# EAGLE design mbc_80_26_08_05_ESP32 (EAGLE 7.6.0)
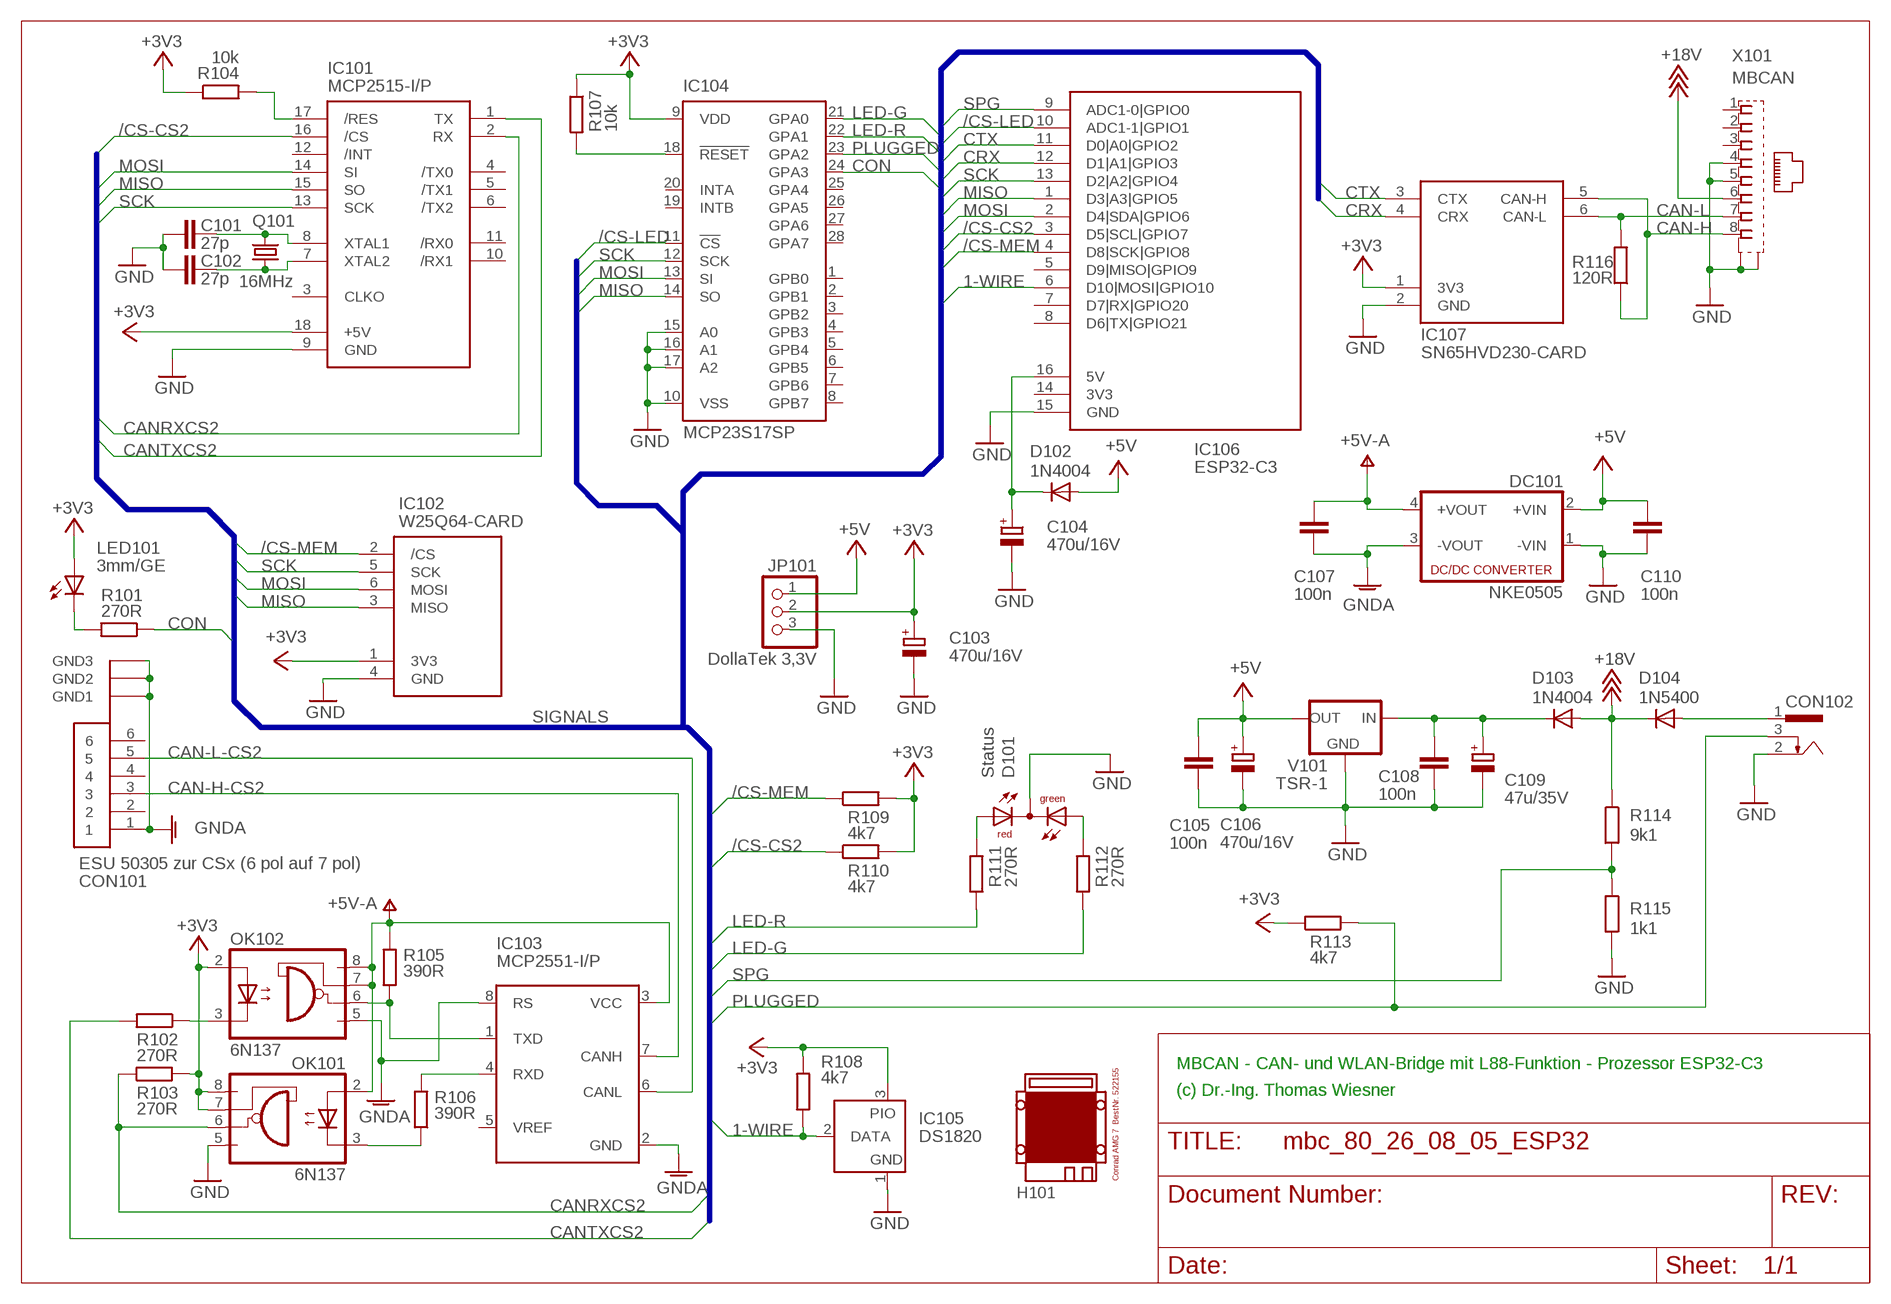
[diagram p0: schematic, sheet 1]

## Parts
C101  27p  C-EU025-025X050  [C025-025X050]
C102  27p  C-EU025-025X050  [C025-025X050]
C103  470u/16V  CPOL-EUE3.5-8  [E3,5-8]
C104  470u/16V  CPOL-EUE3.5-8  [E3,5-8]
C105  100n  C-EU025-025X050  [C025-025X050]
C106  470u/16V  CPOL-EUE3.5-8  [E3,5-8]
C107  100n  C-EU025-025X050  [C025-025X050]
C108  100n  C-EU025-025X050  [C025-025X050]
C109  47u/35V  CPOL-EUE2.5-7  [E2,5-7]
C110  100n  C-EU025-025X050  [C025-025X050]
CON101  ESU 50305 zur CSx (6 pol auf 7 pol)  TM-0508-A6  [MINI-DIN-6-POL]
CON102  POWER-JACK  [POWER-JACK]
D101  Status  DUOLED5MM  [DUOLED5MM]
D102  1N4004  [DO41-10]
D103  1N4004  [DO41-10]
D104  1N5400  [DO201-15]
DC101  NKE0505  NME  [NME]
H101  MODULGEHÄUSE-AMG-7  [MODULGEHÄUSE-AMG-7]
IC101  MCP2515-I/P  MCP2510-I/P  [DIL18]
IC102  W25Q64-CARD  [W25Q64CARD]
IC103  MCP2551-I/P  PCA82C250  [DIL08]
IC104  MCP23S17SP  [DIL28-3]
IC105  DS1820  DS2405  [TO92-]
IC106  ESP32-C3  [ESP32-C3]
IC107  SN65HVD230-CARD  [SN65HVD230-CARD]
JP101  DollaTek 3,3V  PINHD-1X3  [1X03]
LED101  3mm/GE  LED3MM  [LED3MM]
OK101  6N137  [DIL08]
OK102  6N137  [DIL08]
Q101  16MHz  CRYSTALHC49U-V  [HC49U-V]
R101  270R  R-EU_0207/10  [0207/10]
R102  270R  R-EU_0207/10  [0207/10]
R103  270R  R-EU_0207/10  [0207/10]
R104  10k  R-EU_0207/10  [0207/10]
R105  390R  R-EU_0207/10  [0207/10]
R106  390R  R-EU_0207/10  [0207/10]
R107  10k  R-EU_0207/10  [0207/10]
R108  4k7  R-EU_0207/10  [0207/10]
R109  4k7  R-EU_0207/10  [0207/10]
R110  4k7  R-EU_0207/10  [0207/10]
R111  270R  R-EU_0207/10  [0207/10]
R112  270R  R-EU_0207/10  [0207/10]
R113  4k7  R-EU_0207/10  [0207/10]
R114  9k1  R-EU_0207/10  [0207/10]
R115  1k1  R-EU_0207/10  [0207/10]
R116  120R  R-EU_0207/10  [0207/10]
V101  TSR-1  [TRACO-TSR-1]
X101  MBCAN  0446200002  [0446200002]

## Nets
1-WIRE: IC105.2(DATA) IC106.6(D10|MOSI|GPIO10) R108.1
+3V3: C103.+ IC101.18(+5V) IC102.1(3V3) IC104.9(VDD) IC105.3(PIO) IC107.1(3V3) JP101.2 LED101.A OK101.7(VE) OK101.8(VCC) OK102.2(A) R103.2 R104.1 R107.1 R108.2 R109.2 R110.2 R113.1
+5V: C105.1 C106.+ C110.1 D102.A DC101.2(+VIN) JP101.1 V101.OUT
+5V-A: C107.1 DC101.4(+VOUT) IC103.3(VCC) OK101.2(A) OK102.7(VE) OK102.8(VCC) R105.2
+18V: D103.A D104.C R114.1 X101.6
/CS-CS2: IC101.16(/CS) IC106.3(D5|SCL|GPIO7) R110.1
/CS-LED: IC104.11(!CS) IC106.10(ADC1-1|GPIO1)
/CS-MEM: IC102.2(/CS) IC106.4(D8|SCK|GPIO8) R109.1
CAN-H: IC107.5(CAN-H) R116.1 X101.8
CAN-H-CS2: CON101.3 IC103.7(CANH)
CAN-L: IC107.6(CAN-L) R116.2 X101.7
CAN-L-CS2: CON101.5 IC103.6(CANL)
CANRXCS2: IC101.2(RX) OK101.6(VO) R103.1
CANTXCS2: IC101.1(TX) R102.2
CON: IC104.24(GPA3) R101.1
CRX: IC106.12(D1|A1|GPIO3) IC107.4(CRX)
CTX: IC106.11(D0|A0|GPIO2) IC107.3(CTX)
GND: C101.2 C102.2 C103.- C104.- C105.2 C106.- C108.2 C109.- C110.2 CON102.2 D101.K(C) DC101.1(-VIN) IC101.9(GND) IC102.4(GND) IC104.10(VSS) IC104.15(A0) IC104.16(A1) IC104.17(A2) IC105.1(GND) IC106.15(GND) IC107.2(GND) JP101.3 OK101.5(GND) R115.2 V101.GND X101.4 X101.5 X101.S@1(S1) X101.S@2(S2)
GNDA: C107.2 CON101.1 CON101.A1(GND1) CON101.A2(GND2) CON101.A3(GND3) DC101.3(-VOUT) IC103.2(GND) IC103.8(RS) OK102.5(GND)
LED-G: IC104.21(GPA0) R112.1
LED-R: IC104.22(GPA1) R111.1
MISO: IC101.15(SO) IC102.3(MISO) IC104.14(SO) IC106.1(D3|A3|GPIO5)
MOSI: IC101.14(SI) IC102.6(MOSI) IC104.13(SI) IC106.2(D4|SDA|GPIO6)
N$1: IC104.18(!RESET) R107.2
N$2: IC101.17(/RES) R104.2
N$3: LED101.K(C) R101.2
N$6: C108.1 C109.+ D103.C V101.IN
N$7: C101.1 IC101.8(XTAL1) Q101.2
N$8: C102.1 IC101.7(XTAL2) Q101.1
N$9: D101.AR R111.2
N$13: D101.AG R112.2
N$22: C104.+ D102.C IC106.16(5V)
N$40: IC103.1(TXD) OK102.6(VO) R105.1
N$43: OK101.3(C) R106.1
N$44: IC103.4(RXD) R106.2
N$46: OK102.3(C) R102.1
PLUGGED: CON102.3 IC104.23(GPA2) R113.2
SCK: IC101.13(SCK) IC102.5(SCK) IC104.12(SCK) IC106.13(D2|A2|GPIO4)
SPG: IC106.9(ADC1-0|GPIO0) R114.2 R115.1
V-NETZTEIL: CON102.1 D104.A
Unconnected: CON101.2 CON101.4 CON101.6 IC101.3(CLKO) IC101.4(/TX0) IC101.5(/TX1) IC101.6(/TX2) IC101.10(/RX1) IC101.11(/RX0) IC101.12(/INT) IC103.5(VREF) IC104.1(GPB0) IC104.2(GPB1) IC104.3(GPB2) IC104.4(GPB3) IC104.5(GPB4) IC104.6(GPB5) IC104.7(GPB6) IC104.8(GPB7) IC104.19(INTB) IC104.20(INTA) IC104.25(GPA4) IC104.26(GPA5) IC104.27(GPA6) IC104.28(GPA7) IC106.5(D9|MISO|GPIO9) IC106.7(D7|RX|GPIO20) IC106.8(D6|TX|GPIO21) IC106.14(3V3) X101.1 X101.2 X101.3

## Buses
SIGNALS

## Notes on the sheet
- MBCAN - CAN- und WLAN-Bridge mit L88-Funktion - Prozessor ESP32-C3
- (c) Dr.-Ing. Thomas Wiesner

## Library data of the parts
C101 C102 C105 C107 C108 C110 = rcl:C-EU: CAPACITOR, European symbol
C103 C104 C106 C109 = rcl:CPOL-EU: POLARIZED CAPACITOR, European symbol
CON101 = mbc:TM-0508-A6: MINI-DIN 6-pol Printbuchse Reichelt Bestellnummer EB-DIO M06
CON102 = mbc:POWER-JACK: Power-Stecker für 2,5 mm Hohlbuchse
D101 = led:DUOLED5MM: DUO LED 2 colors, 5 mm, round
D102 D103 = diode:1N4004: DIODE general purpose rectifier, 1 A
D104 = diode:1N5400: DIODE standard rectifier, 3 A, 50 V (Motorola)
DC101 = dc-dc-converter:NME: DC-DC CONVERTER; MF: C & D TECHNOLOGIES, INC; MPN: NME1205D; OC_FARNELL: 1021466; OC_NEWARK: 98B8198
H101 = mbc:MODULGEHÄUSE-AMG-7: Gehäuse Conrad AMG 7 BestNr. 522155
IC101 = mbc:MCP2510: BASIC-CAN 2.0a Controller Stand-alone CAN controller von Microchip
IC102 = mbc:W25Q64-CARD: NOR-FLASH 8 MByte mit SPI
IC103 = micro-philips:PCA82C250: CAN CONTROLLER INTERFACE; OC_FARNELL: 3692358; OC_NEWARK: unknown
IC104 = microchip:MCP23S17: http://ww1.microchip.com/downloads/en/DeviceDoc/21952a.pdf Source: http://ww1.microchip.com/downloads/en/DeviceDoc/21952a.pdf; MF: MICROCHIP; MPN: MCP23S17-E/SP; OC_FARNELL: 1292238; OC_NEWARK: 31K2951
IC105 = maxim:DS2405: Addressable Switch DALLAS Semiconductor; MF: DALLAS SEMICONDUCTOR; MPN: DS2405; OC_FARNELL: 1188025; OC_NEWARK: 06F4645
IC106 = mbc:ESP32-C3
IC107 = mbc:SN65HVD230-CARD: CAN-Transceiver für 3V3-Anwendungen. Entferne R2 auf dem Board um fixen Terminator zu vermeiden.
JP101 = pinhead:PINHD-1X3: PIN HEADER
LED101 = led:LED: LED OSRAM: - CHIPLED LG R971, LG N971, LY N971, LG Q971, LY Q971, LO R971, LY R971 LH N974, LH R974 LS Q976, LO Q976, LY Q976 LO Q996 - Hyper CHIPLED LW Q18S LB Q993, LB Q99A, LB R99A - SideLED LS A670, LO A670, LY A670, LG A670, LP A670 LB A673, LV A673, LT A673, LW A673 LH A674 LY A675 LS A676, LA A676, LO A676, LY A676, LW A676 LS A679, LY A679, LG A679 - Hyper Micro SIDELED® LS Y876, LA Y876, LO Y876, LY Y876 LT Y87S - SmartLED LW L88C, LW L88S LB L89C, LB L89S, LG L890 LS L89K, LO L89K, LY L89K LS L896, LA L896, LO L896, LY L896 - TOPLED LS T670, LO T670, LY T670, LG T670, LP T670 LSG T670, LSP T670, LSY T670, LOP T670, LYG T670 LG T671, LOG T671, LSG T671 LB T673, LV T673, LT T673, LW T673 LH T674 LS T676, LA T676, LO T676, LY T676, LB T676, LH T676, LSB T676, LW T676 LB T67C, LV T67C, LT T67C, LS T67K, LO T67K, LY T67K, LW E67C LS E67B, LA E67B, LO E67B, LY E67B, LB E67C, LV E67C, LT E67C LW T67C LS T679, LY T679, LG T679 LS T770, LO T770, LY T770, LG T770, LP T770 LB T773, LV T773, LT T773, LW T773 LH T774 LS E675, LA E675, LY E675, LS T675 LS T776, LA T776, LO T776, LY T776, LB T776 LHGB T686 LT T68C, LB T68C - Hyper Mini TOPLED® LB M676 - Mini TOPLED Santana® LG M470 LS M47K, LO M47K, LY M47K Source: http://www.osram.convergy.de LUXEON: - LUMILED® LXK2-PW12-R00, LXK2-PW12-S00, LXK2-PW14-U00, LXK2-PW14-V00 LXK2-PM12-R00, LXK2-PM12-S00, LXK2-PM14-U00 LXK2-PE12-Q00, LXK2-PE12-R00, LXK2-PE12-S00, LXK2-PE14-T00, LXK2-PE14-U00 LXK2-PB12-K00, LXK2-PB12-L00, LXK2-PB12-M00, LXK2-PB14-N00, LXK2-PB14-P00, LXK2-PB14-Q00 LXK2-PR12-L00, LXK2-PR12-M00, LXK2-PR14-Q00, LXK2-PR14-R00 LXK2-PD12-Q00, LXK2-PD12-R00, LXK2-PD12-S00 LXK2-PH12-R00, LXK2-PH12-S00 LXK2-PL12-P00, LXK2-PL12-Q00, LXK2-PL12-R00 Source: www.luxeon.com KINGBRIGHT: KA-3528ASYC Source: www.kingbright.com
OK101 OK102 = optocoupler:6N137: MOTOROLA OPTO COUPLER; MPN: 6N137; OC_FARNELL: 1328376; OC_NEWARK: 52M1895
Q101 = crystal:CRYSTAL: CRYSTAL; OC_FARNELL: 1666969; OC_NEWARK: unknown
R101-R116 = resistor:R-EU_: RESISTOR, European symbol
V101 = mbc:TSR-1: Spannungsregler Hersteller: TRACO Typ: TSR-1 5V: TSR 1-2450 Spg: 5V Strom: 1A Reichelt TSR 1-2450
X101 = mbc:0446200002: RJ-45 INVERTED MODULAR JACK ASSEMBLY WITH RJ-11 KEEPOUT FEATURE Source: Data sheet <http://www.farnell.com/datasheets/73207.pdf> MOLEX 0446200002 BUCHSE, RJ45, GESCHIRMT Source: Farnell <http://de.farnell.com/molex/0446200002/buchse-rj45-geschirmt/dp/9251910?ost=9251910>; MF: MOLEX; MPN: 0446200002; OC_FARNELL: 9251910

## Board
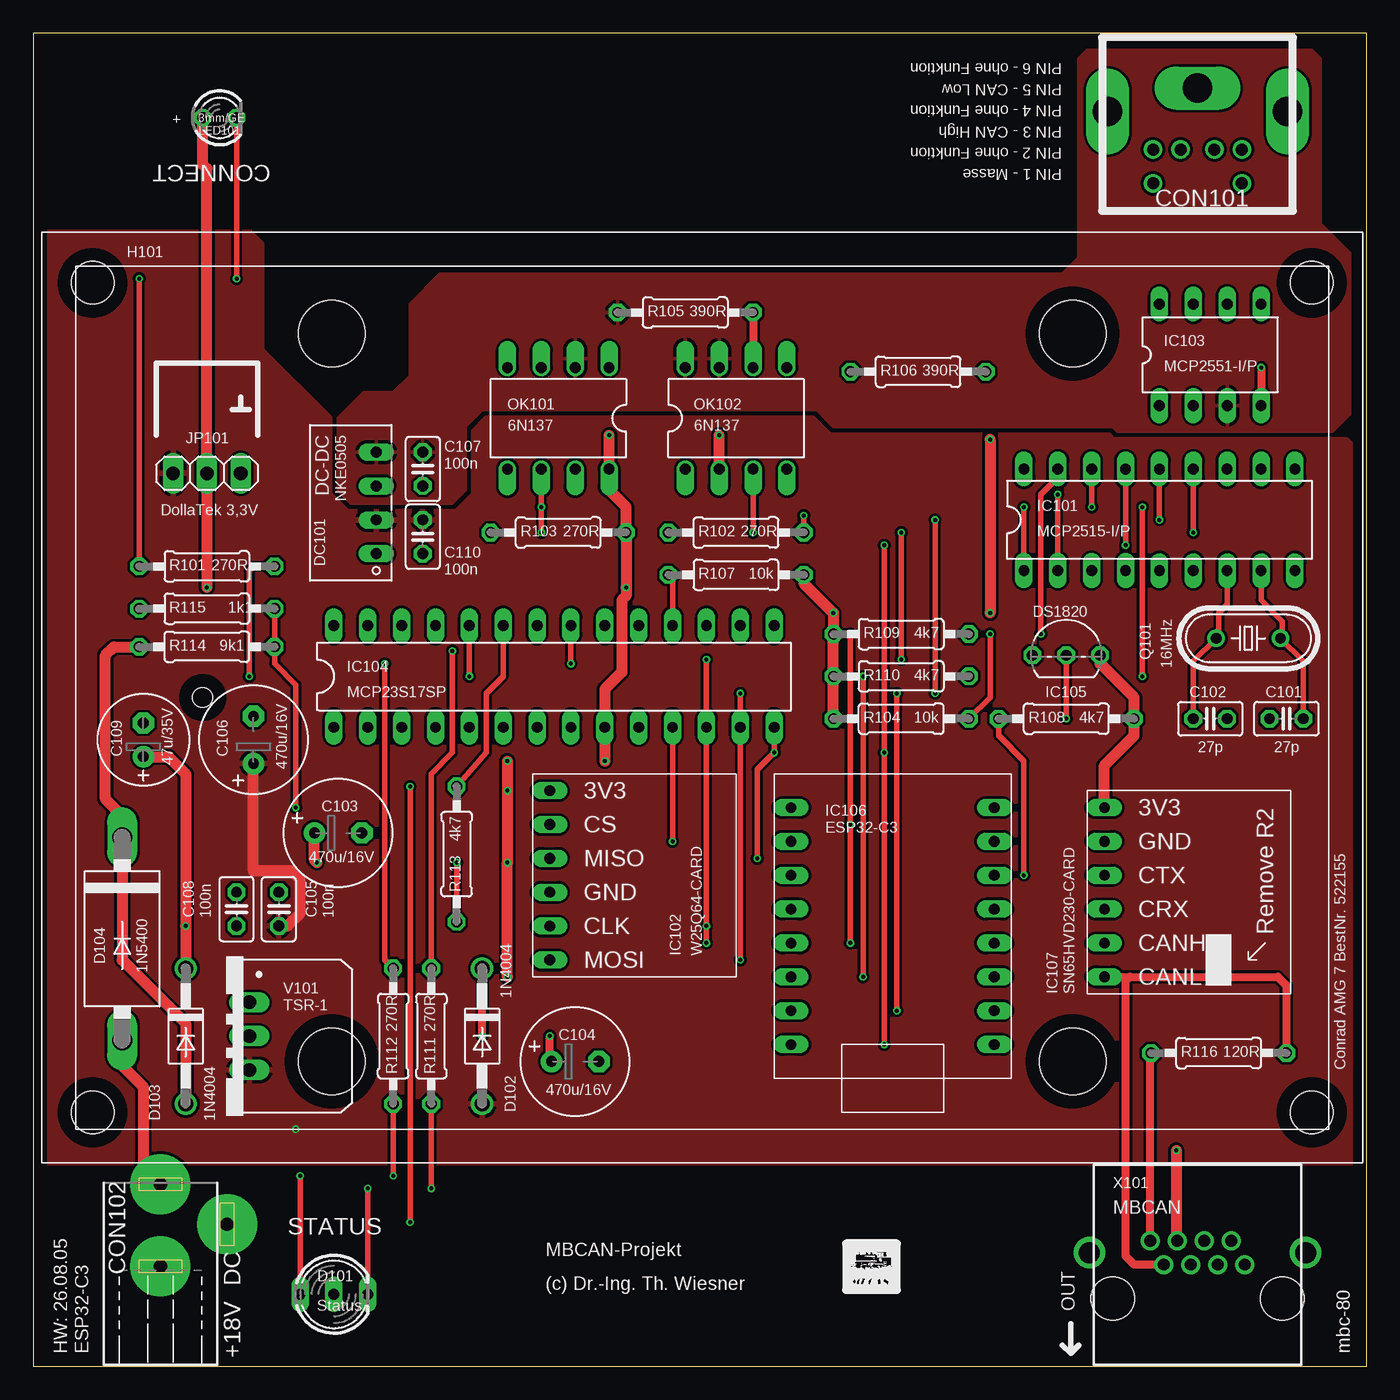
[diagram p1: board, top side]
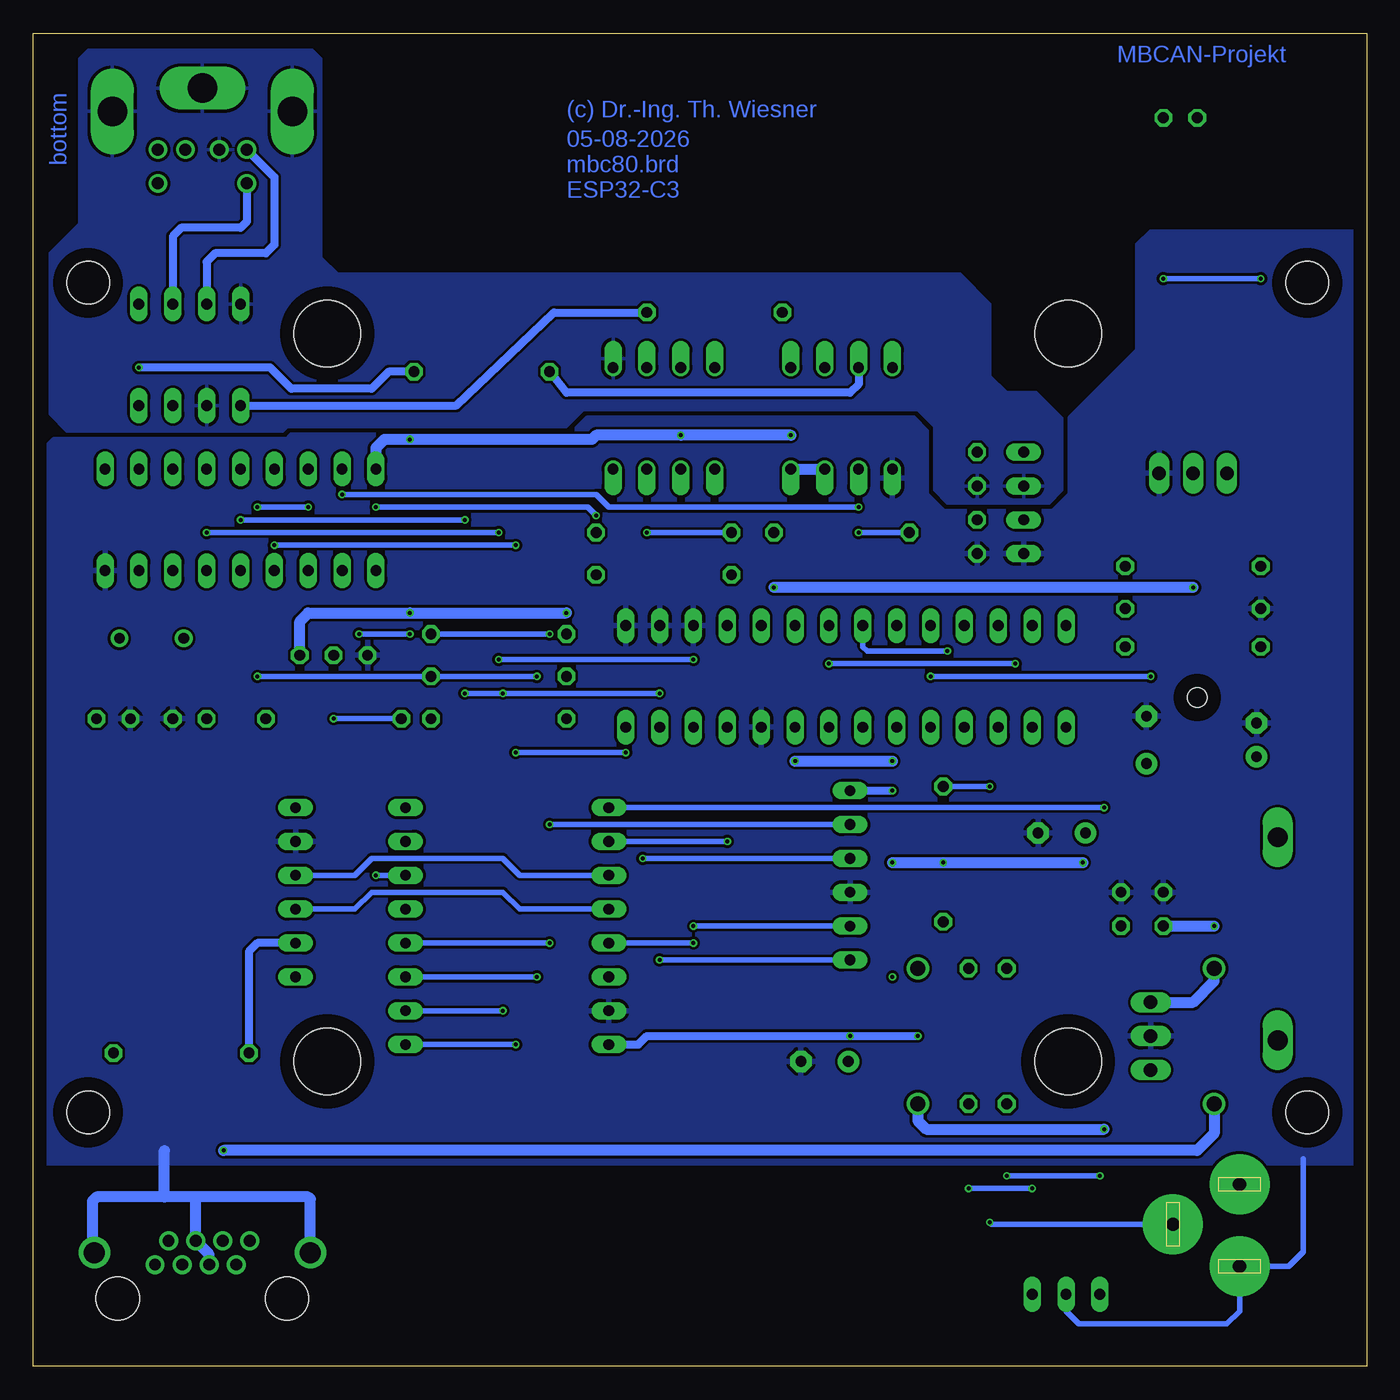
[diagram p2: board, bottom side, seen from below]

Size 99.99 x 100 mm. Coordinates in mm from the lower left corner, seen from the top.
Outline: 0,0 99.99,0 99.99,100 0,100 0,0
Copper layers (1*16): Top 0.035mm / dielectric 1.5mm / Bottom 0.035mm
Design rules "default *": minimum track width 10mil, minimum drill 0.3mm, track to track 8mil, track to pad 8mil, pad to pad 8mil, via to via 8mil, smd to smd 8mil, copper to edge 40mil, drill to drill 8mil, minimum pad ring 10mil, minimum via ring 0.125mm, stop-mask expansion 4mil, vias tented up to drill 0mil, thermal gap 10mil

### Footprints (pad centres in the part's own frame; a part is rotated, then mirrored left to right if it is on the bottom)
C025-025X050 = drill 0.813 octagon: 1 -1.27,0; 2 1.27,0
E3,5-8 = drill 0.813 pad 1.6: + -1.778,0 | drill 0.813 pad 1.6 octagon: - 1.778,0
E2,5-7 = drill 0.813 pad 1.6: + -1.27,0 | drill 0.813 pad 1.6 octagon: - 1.27,0
MINI-DIN-6-POL = drill 0.9: 1 -1.27,-4.604; 2 1.27,-4.604; 3 -3.334,-4.604; 4 3.334,-4.604; 5 -3.334,-7.144; 6 3.334,-7.144 | drill 2.2 pad 2.54 long: A1 0,0.01; A2 -6.75,-1.746; A3 6.75,-1.746
POWER-JACK = drill 1 pad 4.5: 1 0,6.03; 2 0,-0.12; 3 5,3.03
DUOLED5MM = drill 0.813 long: AG -2.54,0; AR 2.54,0; K 0,0
DO41-10 = drill 1.118: A 5.08,0; C -5.08,0
DO201-15 = drill 1.499 long: A 7.62,0; C -7.62,0
NME = drill 0.813 long: 1 0,3.81; 2 0,1.27; 3 0,-1.27; 4 0,-3.81
MODULGEHÄUSE-AMG-7 = hole 3.2: -45.72,-31.115; -45.72,31.115; 45.72,31.115; 45.72,-31.115 | hole 5: -27.781,-27.305; 27.781,-27.305; -27.781,27.305; 27.781,27.305 | hole 1.5: -37.465,0
DIL18 = drill 0.813 long: 1 -10.16,-3.81; 2 -7.62,-3.81; 3 -5.08,-3.81; 4 -2.54,-3.81 | drill 0.8 long: 5 0,-3.81; 6 2.54,-3.81; 7 5.08,-3.81; 8 7.62,-3.81; 9 10.16,-3.81; 10 10.16,3.81; 11 7.62,3.81; 12 5.08,3.81; 13 2.54,3.81; 14 0,3.81; 15 -2.54,3.81; 16 -5.08,3.81; 17 -7.62,3.81; 18 -10.16,3.81
W25Q64CARD = drill 0.8 long: 1 -6.35,6.35; 2 -6.35,3.81; 3 -6.35,1.27; 4 -6.35,-1.27; 5 -6.35,-3.81; 6 -6.35,-6.35
DIL08 = drill 0.813 long: 1 -3.81,-3.81; 2 -1.27,-3.81; 3 1.27,-3.81; 4 3.81,-3.81; 5 3.81,3.81; 6 1.27,3.81; 7 -1.27,3.81; 8 -3.81,3.81
DIL28-3 = drill 0.813 long: 1 -16.51,-3.81; 2 -13.97,-3.81; 3 -11.43,-3.81; 4 -8.89,-3.81; 5 -6.35,-3.81; 6 -3.81,-3.81; 7 -1.27,-3.81; 8 1.27,-3.81; 9 3.81,-3.81; 10 6.35,-3.81; 11 8.89,-3.81; 12 11.43,-3.81; 13 13.97,-3.81; 14 16.51,-3.81; 15 16.51,3.81; 16 13.97,3.81; 17 11.43,3.81; 18 8.89,3.81; 19 6.35,3.81; 20 3.81,3.81; 21 1.27,3.81; 22 -1.27,3.81; 23 -3.81,3.81; 24 -6.35,3.81; 25 -8.89,3.81; 26 -11.43,3.81; 27 -13.97,3.81; 28 -16.51,3.81
TO92- = drill 0.813 octagon: 1 -2.54,0; 2 0,0; 3 2.54,0
ESP32-C3 = drill 0.8 long: 1 -7.62,8.89; 2 -7.62,6.35; 3 -7.62,3.81; 4 -7.62,1.27; 5 -7.62,-1.27; 6 -7.62,-3.81; 7 -7.62,-6.35; 8 -7.62,-8.89; 9 7.62,-8.89; 10 7.62,-6.35; 11 7.62,-3.81; 12 7.62,-1.27; 13 7.62,1.27; 14 7.62,3.81; 15 7.62,6.35; 16 7.62,8.89
SN65HVD230-CARD = drill 0.8 long: 1 -6.35,6.35; 2 -6.35,3.81; 3 -6.35,1.27; 4 -6.35,-1.27; 5 -6.35,-3.81; 6 -6.35,-6.35
1X03 = drill 1.016 long: 1 -2.54,0; 2 0,0; 3 2.54,0
LED3MM = drill 0.813 octagon: A -1.27,0; K 1.27,0
DIL08' = drill 0.813 offset: 1 -3.81,-3.81; 2 -1.27,-3.81; 3 1.27,-3.81; 4 3.81,-3.81; 5 3.81,3.81; 6 1.27,3.81; 7 -1.27,3.81; 8 -3.81,3.81
HC49U-V = drill 0.813: 1 -2.413,0; 2 2.413,0
0207/10 = drill 0.813 octagon: 1 -5.08,0; 2 5.08,0
TRACO-TSR-1 = drill 1.016 long: GND 0,2.54; IN -2.54,2.54; OUT 2.54,2.54
0446200002 = drill 0.889 pad 1.422: 1 3.556,2.54; 2 2.54,4.318; 3 1.524,2.54; 4 0.508,4.318; 5 -0.508,2.54; 6 -1.524,4.318; 7 -2.54,2.54; 8 -3.556,4.318 | drill 1.575 pad 2.286: S@1 -8.103,3.429; S@2 8.103,3.429 | hole 3.251: 6.35,0; -6.35,0

### Placement (x,y rotation side)
C101  93.98,48.58 180 top
C102  88.27,48.58 0 top
C103  22.86,40.01 0 top
C104  40.64,22.86 0 top
C105  18.41,34.29 90 top
C106  16.51,46.99 90 top
C107  29.21,67.31 270 top
C108  15.24,34.29 90 top
C109  8.26,46.99 90 top
C110  29.21,62.23 270 top
CON101  87.31,95.89 0 top
CON102  9.53,7.62 0 top
D101  22.54,5.4 0 top
D102  33.66,24.77 270 top
D103  11.43,24.77 270 top
D104  6.67,32.07 270 top
DC101  25.72,64.77 180 top
H101  50.16,50.16 0 top
IC101  84.45,63.5 0 top
IC102  45.09,36.83 0 top
IC103  88.27,75.88 0 top
IC104  39.05,51.75 0 top
IC105  77.47,53.34 0 top
IC106  64.45,33.02 180 top
IC107  86.68,35.56 0 top
JP101  13.02,66.99 0 top
LED101  13.97,93.66 0 top
OK101  6N137  [DIL08']  39.37,71.12 180 top
OK102  6N137  [DIL08']  52.7,71.12 0 top
Q101  91.12,54.61 0 top
R101  13.02,60.01 180 top
R102  52.7,62.55 0 top
R103  39.37,62.55 0 top
R104  65.09,48.58 0 top
R105  48.9,79.06 180 top
R106  66.36,74.61 0 top
R107  52.7,59.37 180 top
R108  77.47,48.58 0 top
R109  65.09,54.93 180 top
R110  65.09,51.75 180 top
R111  29.84,24.77 270 top
R112  26.99,24.77 270 top
R113  31.75,38.42 90 top
R114  13.02,53.98 0 top
R115  13.02,56.83 180 top
R116  88.9,23.5 0 top
V101  13.65,24.77 270 top
X101  87.31,5.08 0 top

### Tracks (layer width: path | path; a pad name or v marks a point on that pad's centre or on a via)
1-WIRE  (via drill 0.3)
  Top 0.406: v74.3,36.83 74.3,45.4 72.39,47.31 R108.1 | IC105.2 v77.47,48.58
  Bottom 0.406: IC106.6 v74.3,36.83 | v77.47,48.58 R108.1
+3V3  (via drill 0.3)
  Top 0.406: R113.1 v31.75,37.78
  Top 0.813: v35.56,29.21 v35.56,37.78 v35.56,43.18 v35.56,45.4 | v21.27,37.78 21.08,37.97 C103.+ | v42.86,45.4 IC104.9 42.86,50.8 44.13,52.07 44.13,57.47 44.45,57.78 v44.45,58.42 R103.2 44.45,64.45 43.18,65.72 OK101.8 v43.18,69.85 | OK102.2 v51.44,69.85 | v13.02,58.42 JP101.2 13.02,89.85 12.7,90.17 LED101.A | R104.1 R110.2 R109.2 v60.01,56.52 57.78,58.74 R107.1 | IC107.1 80.33,45.09 82.55,47.31 R108.2 82.55,50.16 80.01,52.7 IC105.3 | v71.75,69.53 v71.75,56.52
  Bottom 0.61: IC102.1 v35.56,43.18
  Bottom 0.813: v35.56,37.78 v31.75,37.78 v21.27,37.78 | v42.86,45.4 v35.56,45.4 | OK101.8 OK101.7 | v43.18,69.85 v51.44,69.85 57.78,69.85 58.1,69.53 v71.75,69.53 73.66,69.53 74.3,68.9 IC101.18 | v13.02,58.42 v44.45,58.42 | IC105.3 80.01,55.88 79.38,56.52 v71.75,56.52 v60.01,56.52
+5V  (via drill 0.3)
  Top 0.813: C105.1 19.05,33.02 20,33.97 20,36.51 19.37,37.15 16.51,37.15 C106.+
  Bottom 0.813: D102.A 33.66,18.41 33.02,17.78 v19.68,17.78
  pour Top: 0.64,15.24 99.69,15.24 99.69,68.26 98.42,69.53 80.96,69.53 80.64,69.85 59.69,69.85 58.42,71.12 33.97,71.12 33.02,70.17 33.02,65.41 31.75,64.14 23.5,64.14 22.23,65.41 22.23,71.12 17.14,76.2 17.14,84.14 16.19,85.09 0.64,85.09
+5V-A
  pour Top: 23.81,64.77 31.43,64.77 32.38,65.72 32.38,70.48 33.66,71.75 58.74,71.75 60.01,70.48 80.96,70.48 81.28,70.17 97.47,70.17 98.74,71.44 98.74,83.5 96.52,85.72 96.52,98.11 95.89,98.74 79.06,98.74 78.42,98.11 78.42,83.19 77.15,81.92 30.48,81.92 28.26,79.69 28.26,74.3 26.99,73.03 24.77,73.03 22.86,71.12 22.86,65.72
+18V  (via drill 0.3)
  Top 0.813: v85.72,16.19 85.72,9.46 X101.6 | D103.A 11.43,25.72 6.67,30.48 D104.C 6.67,41.27 5.4,42.55 5.4,53.34 6.03,53.98 R114.1
  Bottom 0.813: D103.A 11.43,17.46 12.7,16.19 v85.72,16.19
/CS-CS2  (via drill 0.3)
  Top 0.406: v62.23,29.21 v62.23,51.75 | v83.19,51.75 v83.19,64.45 | v79.38,64.45 IC101.16
  Bottom 0.406: IC106.3 v62.23,29.21 | v62.23,51.75 R110.1 v83.19,51.75 | v83.19,64.45 v79.38,64.45
/CS-LED  (via drill 0.3)
  Top 0.406: v47.94,39.37 IC104.11
  Bottom 0.406: IC106.10 v47.94,39.37
/CS-MEM  (via drill 0.3)
  Top 0.406: v61.28,31.75 v61.28,40.64 v61.28,54.93
  Bottom 0.406: R109.1 v61.28,54.93 | IC106.4 v61.28,31.75 | IC102.2 v61.28,40.64
CAN-H
  Top 0.61: X101.8 83.76,22.29 R116.1
  Bottom 0.61: IC107.5 83.19,31.75 83.82,31.11 R116.1
CAN-H-CS2
  Bottom 0.61: CON101.3 | CON101.3 81.92,89.22 81.92,84.14 82.55,83.5 86.36,83.5 87,82.87 IC103.7
CAN-L
  Top 0.61: IC107.6 82.23,29.21 | 82.23,29.21 93.34,29.21 93.98,28.57 R116.2 | X101.7 82.55,7.62 81.92,8.26 81.92,28.89 82.23,29.21
CAN-L-CS2
  Bottom 0.61: CON101.5 83.98,85.88 84.45,85.41 88.9,85.41 89.53,84.77 IC103.6
CANRXCS2  (via drill 0.3)
  Top 0.406: IC101.2 v76.83,65.41 | OK101.6 v38.1,64.45 v38.1,62.55
  Bottom 0.406: v76.83,65.41 57.78,65.41 56.83,64.45 v38.1,64.45 | v38.1,62.55 R103.1
CANTXCS2  (via drill 0.3)
  Top 0.406: IC101.1 v74.3,64.45 | v57.78,63.82 R102.2
  Bottom 0.406: v74.3,64.45 58.42,64.45 v57.78,63.82
CON  (via drill 0.3)
  Top 0.406: R101.1 16.51,60.01 16.19,59.69 v16.19,51.75 | v32.7,51.75 IC104.24
  Bottom 0.406: v16.19,51.75 v32.7,51.75
CRX
  Bottom 0.406: IC106.12 63.5,34.29 64.77,35.56 74.61,35.56 75.88,34.29 IC107.4
CTX
  Bottom 0.406: IC106.11 63.5,36.83 64.77,38.1 74.61,38.1 75.88,36.83 IC107.3
GND
  Bottom 0.406: D101.K 22.54,4.13 21.59,3.17 10.48,3.17 9.53,4.13 CON102.2 5.83,7.5 4.76,8.57 4.76,15.56
  Bottom 0.813: X101.S@1 79.21,12.54 79.38,12.7 87.95,12.7 | 90.17,12.7 95.25,12.7 95.57,12.38 95.57,8.66 X101.S@2 | X101.5 86.81,8.38 X101.4 87.82,12.57 87.95,12.7 | 87.95,12.7 90.17,12.7 | 90.17,12.7 90.17,16.19
  pour Bottom: 0.64,85.09 0.64,15.24 99.69,15.24 99.69,68.26 98.42,69.53 80.96,69.53 80.64,69.85 59.69,69.85 58.42,71.12 33.97,71.12 33.02,70.17 33.02,65.41 31.75,64.14 23.5,64.14 22.23,65.41 22.23,71.12 17.14,76.2 17.14,84.14 16.19,85.09
GNDA
  pour Bottom: 23.81,64.77 31.43,64.77 32.38,65.72 32.38,70.48 33.66,71.75 58.74,71.75 60.01,70.48 80.96,70.48 81.28,70.17 97.47,70.17 98.74,71.44 98.74,83.5 96.52,85.72 96.52,98.11 95.89,98.74 79.06,98.74 78.42,98.11 78.42,83.19 77.15,81.92 30.48,81.92 28.26,79.69 28.26,74.3 26.99,73.03 24.77,73.03 22.86,71.12 22.86,65.72
LED-G  (via drill 0.3)
  Top 0.406: R112.1 26.35,30.48 v26.35,52.7 | v40.32,52.7 IC104.21
  Bottom 0.406: v26.35,52.7 v40.32,52.7
LED-R  (via drill 0.3)
  Top 0.406: R111.1 29.84,44.45 31.43,46.04 v31.43,53.66
  Bottom 0.406: v31.43,53.66 37.47,53.66 37.78,53.98 IC104.22
MISO  (via drill 0.3)
  Top 0.406: IC104.14 v55.56,46.04 54.29,44.77 v54.29,38.1 | v81.92,61.59 IC101.15 | v63.82,24.13 v63.82,46.04 v63.82,61.59
  Bottom 0.406: v55.56,46.04 v63.82,46.04 | v63.82,61.59 v81.92,61.59 | v63.82,24.13 IC106.1 | v54.29,38.1 IC102.3
MOSI  (via drill 0.3)
  Top 0.406: v53.02,50.48 IC104.13 v53.02,30.48 | v67.63,50.48 v67.63,63.5 | v84.45,63.5 IC101.14 | v64.77,26.67 v64.77,50.48
  Bottom 0.406: v53.02,50.48 v64.77,50.48 v67.63,50.48 | v67.63,63.5 v84.45,63.5 | IC106.2 v64.77,26.67 | v53.02,30.48 IC102.6
N$1
  Top 0.406: IC104.18 47.94,59.05 R107.2
N$2  (via drill 0.3)
  Top 0.406: IC101.17 76.83,66.67 75.56,65.41 v75.56,54.93 | v71.75,54.93 71.75,50.16 R104.2
  Bottom 0.406: v75.56,54.93 v71.75,54.93
N$3  (via drill 0.3)
  Top 0.406: R101.2 v7.94,81.6 | v15.24,81.6 LED101.K
  Bottom 0.406: v7.94,81.6 v15.24,81.6
N$6  (via drill 0.3)
  Top 0.813: C109.+ 10.16,45.72 11.43,44.45 v11.43,33.02 D103.C
  Bottom 0.813: C108.1 v11.43,33.02 | V101.IN 13.02,27.3 11.43,28.89 D103.C
N$7
  Top 0.406: IC101.8 92.08,57.47 93.66,55.88 93.66,54.74 Q101.2 95.25,52.9 C101.1
N$8
  Top 0.406: IC101.7 89.53,57.15 88.9,56.52 88.9,54.8 Q101.1 87,52.9 C102.1
N$9  (via drill 0.3)
  Top 0.406: D101.AR v25.08,13.34 | v29.84,13.34 R111.2
  Bottom 0.406: v25.08,13.34 v29.84,13.34
N$13  (via drill 0.3)
  Top 0.406: D101.AG v20,14.29 | v26.99,14.29 R112.2
  Bottom 0.406: v20,14.29 v26.99,14.29
N$22  (via drill 0.3)
  Top 0.61: v33.66,24.77 D102.C | 38.86,22.42 C104.+ 38.86,23.05 38.73,23.18 v38.73,24.77
  Bottom 0.61: IC106.16 54.61,24.13 53.98,24.77 v38.73,24.77 v33.66,24.77
N$40
  Top 0.61: R105.1 OK102.6
  Bottom 0.61: IC103.1 68.26,72.07 60.96,79.06 R105.1
N$43
  Bottom 0.61: OK101.3 38.1,73.66 38.73,73.03 60.01,73.03 R106.1
N$44  (via drill 0.3)
  Top 0.61: v92.08,74.93 IC103.4
  Bottom 0.61: R106.2 73.34,74.61 74.61,73.34 80.64,73.34 82.23,74.93 v92.08,74.93
N$46  (via drill 0.3)
  Top 0.406: OK102.3 v53.98,62.55
  Bottom 0.406: v53.98,62.55 R102.1
PLUGGED  (via drill 0.3)
  Top 0.406: IC104.23 35.24,51.75 33.97,50.48 33.97,46.04 R113.2 | v28.26,10.79 v28.26,43.5
  Bottom 0.406: CON102.3 28.11,10.65 v28.26,10.79 | v28.26,43.5 R113.2
SCK  (via drill 0.3)
  Top 0.406: v50.48,53.02 IC104.12 v50.48,33.02 v50.48,31.75 | v65.09,53.02 v65.09,62.55 | v87,62.55 IC101.13
  Bottom 0.406: v50.48,53.02 v65.09,53.02 | v65.09,62.55 v87,62.55 | v50.48,31.75 IC106.13 | IC102.5 v50.48,33.02
SPG  (via drill 0.3)
  Top 0.406: R115.1 R114.2 18.1,52.7 19.68,51.12 v19.68,41.91
  Bottom 0.406: v19.68,41.91 IC106.9
V-NETZTEIL
  Top 0.813: D104.A 6.67,22.54 8.26,20.95 8.26,14.92 CON102.1

### Text on the board
Bottom: MBCAN-Projekt | bottom | (c) Dr.-Ing. Th. Wiesner | 05-08-2026 | mbc80.brd | ESP32-C3
tNames: PIN 6 - ohne Funktion | PIN 5 - CAN Low | PIN 4 - ohne Funktion | + | PIN 3 - CAN High | PIN 2 - ohne Funktion | CONNECT | PIN 1 - Masse | STATUS | MBCAN-Projekt | DC | (c) Dr.-Ing. Th. Wiesner | OUT | HW: 26.08.05 | ESP32-C3 | +18V | mbc-80